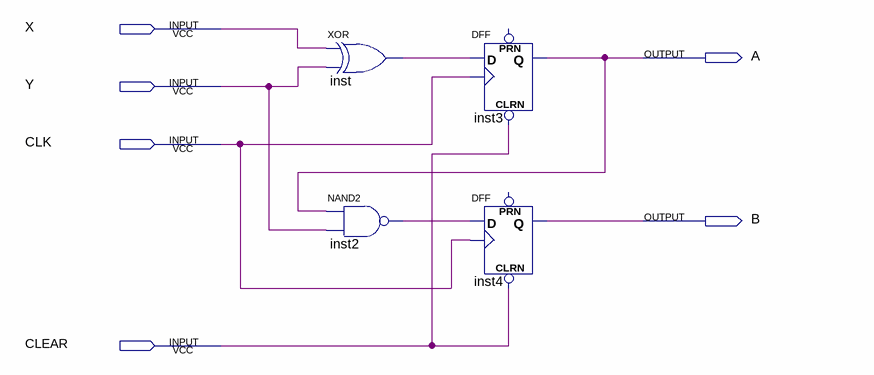
[diagram p0: schematic sheet]
// Quartus schematic Lab1.bdf as structural Verilog: 4 symbols, 6 pins
module Lab1 (
  input  X,
  input  Y,
  input  CLK,
  input  CLEAR,
  output A,
  output B
);

  wire inst2_out, inst_out;

  xor inst (inst_out, X, Y);
  nand inst2 (inst2_out, A, Y);
  DFF inst3 (.CLRN(CLEAR), .CLK(CLK), .D(inst_out), .Q(A));  // open: PRN
  DFF inst4 (.CLRN(CLEAR), .CLK(CLK), .D(inst2_out), .Q(B));  // open: PRN
endmodule
